# Altium schematic sheet ads1299_Regulators.SchDoc
size A4
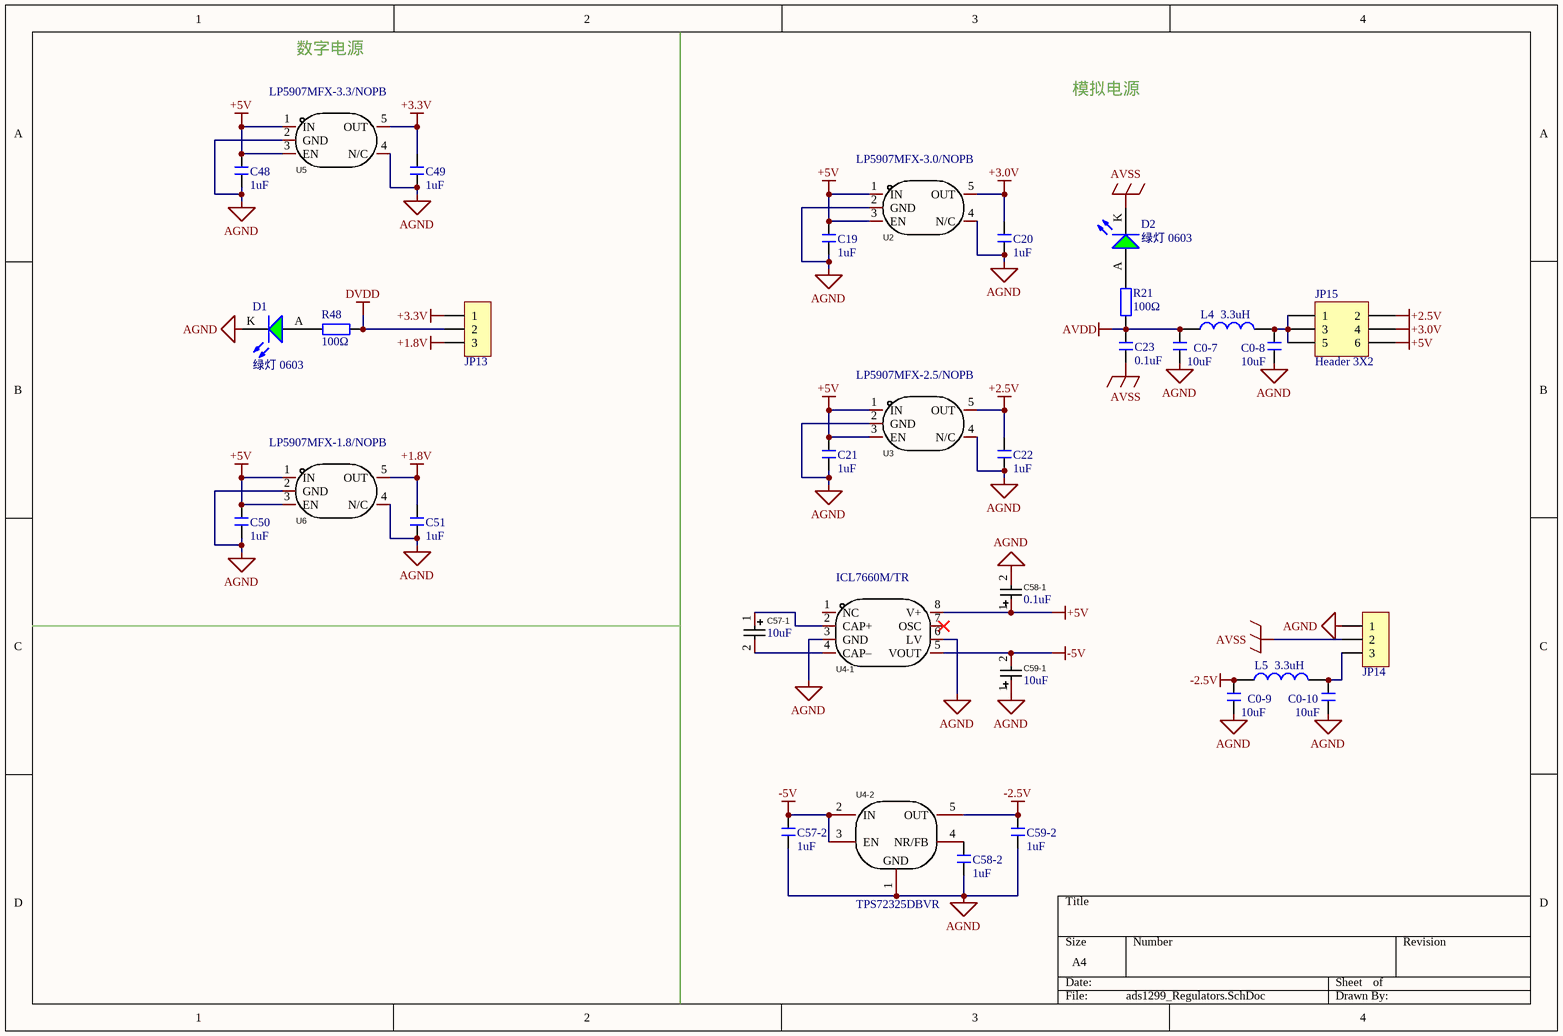
[diagram p0: ads1299_Regulators.SchDoc]

## Parts
C0-7  10uF  [0603C]
C0-8  10uF  [0603C]
C0-9  10uF  [0603C]
C0-10  10uF  [0603C]
C19  1uF  [0603C]
C20  1uF  [0603C]
C21  1uF  [0603C]
C22  1uF  [0603C]
C23  0.1uF  [0603C]
C48  1uF  [0603C]
C49  1uF  [0603C]
C50  1uF  [0603C]
C51  1uF  [0603C]
C57-1  10uF  [Tantalum_cap]
C57-2  1uF  [0603C]
C58-1  0.1uF  [Tantalum_cap]
C58-2  1uF  [0603C]
C59-1  10uF  [Tantalum_cap]
C59-2  1uF  [0603C]
D1  绿灯 0603  [LED 0603G]
D2  绿灯 0603  [LED 0603G]
JP13  HDR-1X3  [HDR2.54-LI-3P]  (value not drawn)
JP14  HDR-1X3  [HDR2.54-LI-3P]  (value not drawn)
JP15  Header 3X2  [HDR2.54-LI-2x3P]
L4  3.3uH  [L 1206]
L5  3.3uH  [L 1206]
R21  100Ω  [0603R]
R48  100Ω  [0603R]
U2  LP5907MFX-3.0/NOPB  [SOT23-5]
U3  LP5907MFX-2.5/NOPB  [SOT23-5]
U4-1  ICL7660M/TR  [SOIC-8]
U4-2  TPS72325DBVR  [SOT23-5]
U5  LP5907MFX-3.3/NOPB  [SOT23-5]
U6  LP5907MFX-1.8/NOPB  [SOT23-5]

## Nets
+1.8V: C51.2 JP13.3 U6.5(OUT)
+2.5V: C22.2 JP15.2 U3.5(OUT)
+3.0V: C20.2 JP15.4 U2.5(OUT)
+3.3V: C49.2 JP13.1 U5.5(OUT)
+5V: C19.2 C21.2 C48.2 C50.2 C58-1.1 JP15.6 U2.1(IN) U2.3(EN) U3.1(IN) U3.3(EN) U4-1.8(V+) U5.1(IN) U5.3(EN) U6.1(IN) U6.3(EN)
-2.5V: C0-9.2 C59-2.2 L5.1 U4-2.5(OUT)
-5V: C57-2.2 C59-1.2 U4-1.5(VOUT) U4-2.2(IN) U4-2.3(EN)
AGND: C0-7.1 C0-8.1 C0-9.1 C0-10.1 C19.1 C20.1 C21.1 C22.1 C48.1 C49.1 C50.1 C51.1 C57-2.1 C58-1.2 C58-2.1 C59-1.1 C59-2.1 D1.K JP14.1 U2.2(GND) U2.4(N/C) U3.2(GND) U3.4(N/C) U4-1.3(GND) U4-1.6(LV) U4-2.1(GND) U5.2(GND) U5.4(N/C) U6.2(GND) U6.4(N/C)
AVDD: C0-7.2 C23.2 L4.1 R21.2
AVSS: C23.1 D2.K JP14.2
DVDD: JP13.2 R48.2
NetC0-8_2: C0-8.2 JP15.1 JP15.3 JP15.5 L4.2
NetC0-10_2: C0-10.2 JP14.3 L5.2
NetC57-1_1: C57-1.1 U4-1.2(CAP+)
NetC57-1_2: C57-1.2 U4-1.4(CAP–)
NetC58-2_2: C58-2.2 U4-2.4(NR/FB)
NetD1_A: D1.A R48.1
NetD2_A: D2.A R21.1

Not connected (* = marked no-connect by the designer): U4-1 1(NC) 7(OSC)*

## Notes on the sheet
- 数字电源
- 模拟电源

## Library data of the parts
C0-7-C0-10 C19-C23 C48-C51 C57-2 C58-2 C59-2 = C: Chip  Ceramic Capacitor; BOM名称: 无极性贴片电容; 版权归属: 源创客; 学习资源: www.ooocke.com
C57-1 C58-1 C59-1 = Tantalum_cap: Manufacturer: Kyocera AVX; Name: 1uF; Symbol: TAJA105K035RNJ; Add into BOM: yes; Value: 1uF; Tolerance: ±10%; Rated Voltage: 35V; Equivalent Series Resistance(ESR): 7.5Ω@100kHz; Device: TAJA105K035RNJ; LCSC Part Name: 1uF ±10% 35V; Supplier Part: C7176; Manufacturer Part: TAJA105K035RNJ; Supplier Footprint: CASE-A_3216; JLCPCB Part Class: Extended Part; Datasheet: https://atta.szlcsc.com/upload/public/pdf/source/20160107/1457707748301.pdf; Supplier: LCSC; Convert to PCB: yes; Operating Temperature: -55℃~+125℃
D1 D2 = 0603 绿灯: 发光二极管; ComponentLink1Description: 供应商链接; ComponentLink1URL: http://www.szlcsc.com/product/details_73152.html; Package: 0603; Supplier: LC; SuppliersPartNumber: C72043
JP13 JP14 = Header 3: 3P接插件; 版权归属: 源创客; BOM名称: 3P接插件; 学习资源: www.ooocke.com
JP15 = Header 3X2: Header, 3-Pin, Dual row; LatestRevisionDate: 17-Jul-2002; LatestRevisionNote: Re-released for DXP Platform.; Publisher: Altium Limited
L4 L5 = L 1206: 小功率贴片电感; 版权归属: 源创客; BOM名称: 小功率贴片电感; 学习资源: www.ooocke.com
R21 R48 = R: 贴片电阻; 版权归属: 源创客; BOM名称: 贴片电阻; 学习资源: www.ooocke.com
U2 U3 U5 U6 = LP5907MFX-3.3/NOPB: Manufacturer: TI(德州仪器); Add into BOM: yes; Output Type: 固定; Output Polarity: 正; Number of Outputs: 1; Maximum Input Voltage: 5.5V; Output Voltage: 3.3V; Dropout Voltage: 250mV@(250mA); Output Current: 250mA; Power Supply Rejection Ratio (PRSS): 90dB@(100Hz),60dB@(100kHz); Name: LP5907MFX-3.3/NOPB; Symbol: LP5907MFX-3.3/NOPB; Device: LP5907MFX-3.3/NOPB; LCSC Part Name: Vin=5.5V Vout=3.3V 250mA 90dB@(100Hz),60dB@(100kHz); Supplier Part: C80670; Manufacturer Part: LP5907MFX-3.3/NOPB; Supplier Footprint: SOT-23-5; JLCPCB Part Class: Extended Part; Datasheet: https://atta.szlcsc.com/upload/public/pdf/source/20160830/1472551528598.pdf; Supplier: LCSC; Convert to PCB: yes
U4-1 = ICL7660M/TR: Manufacturer: HGSEMI(华冠); Add into BOM: yes; Name: ICL7660M/TR; Symbol: ICL7660M/TR; Device: ICL7660M/TR; LCSC Part Name: ICL7660M/TR; Supplier Part: C356724; Manufacturer Part: ICL7660M/TR; Supplier Footprint: SOP-8; JLCPCB Part Class: Extended Part; Datasheet: https://atta.szlcsc.com/upload/public/pdf/source/20220223/B7DC69E53F1DD57A8AF8717E7604F527.pdf; Supplier: LCSC; Convert to PCB: yes
U4-2 = TPS72325DBVR: Manufacturer: TI(德州仪器); Add into BOM: yes; Output Type: 固定; Output Polarity: 负; Number of Outputs: 1; Maximum Input Voltage: 10V; Output Voltage: 2.5V; Dropout Voltage: 500mV@(200mA); Output Current: 200mA; Power Supply Rejection Ratio (PSRR): 65dB; Name: TPS72325DBVR; Symbol: TPS72325DBVR; Device: TPS72325DBVR; LCSC Part Name: 负 Vin=10V Vout=2.5V 200mA 65dB; Supplier Part: C69932; Manufacturer Part: TPS72325DBVR; Supplier Footprint: SOT-23-5; JLCPCB Part Class: Extended Part; Datasheet: https://atta.szlcsc.com/upload/public/pdf/source/20171113/C69932_15105675558771116637.pdf; Supplier: LCSC; Convert to PCB: yes